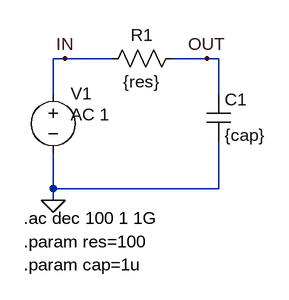
[diagram p0: schematic rc.asc]
rc.asc, the LTspice schematic file:
Version 4.1
SHEET 1 880 680
WIRE 112 96 96 96
WIRE 176 96 112 96
WIRE 304 96 256 96
WIRE 320 96 304 96
WIRE 96 144 96 96
WIRE 320 144 320 96
WIRE 96 272 96 224
WIRE 320 272 320 208
WIRE 320 272 96 272
WIRE 96 288 96 272
FLAG 96 288 0
FLAG 112 96 IN
FLAG 304 96 OUT
SYMBOL cap 304 144 R0
SYMATTR InstName C1
SYMATTR Value {cap}
SYMBOL res 272 80 R90
WINDOW 0 0 56 VBottom 2
WINDOW 3 32 56 VTop 2
SYMATTR InstName R1
SYMATTR Value {res}
SYMBOL voltage 96 128 R0
WINDOW 3 24 44 Left 2
WINDOW 123 24 44 Left 2
WINDOW 39 0 0 Left 0
SYMATTR Value ""
SYMATTR Value2 AC 1
SYMATTR InstName V1
TEXT 56 312 Left 2 !.ac dec 100 1 1G
TEXT 56 344 Left 2 !.param res=100\n.param cap=1u

The netlist it stands for:
* rc.asc
C1 OUT 0 {cap}
R1 OUT IN {res}
V1 IN 0 AC 1
.ac dec 100 1 1G
.param res=100
.param cap=1u
.backanno
.end